# EasyEDA Pro project 恒温器.eprj, schematic Schematic2
Board Name: 加热器重制; Create Date: 2026-02-04; Page Name: P1; Project Name: 基准; Schematic Name: Schematic2; Update Date: 2026-02-23; Company: 嘉立创EDA; Page Size: A4; Version: V1.0
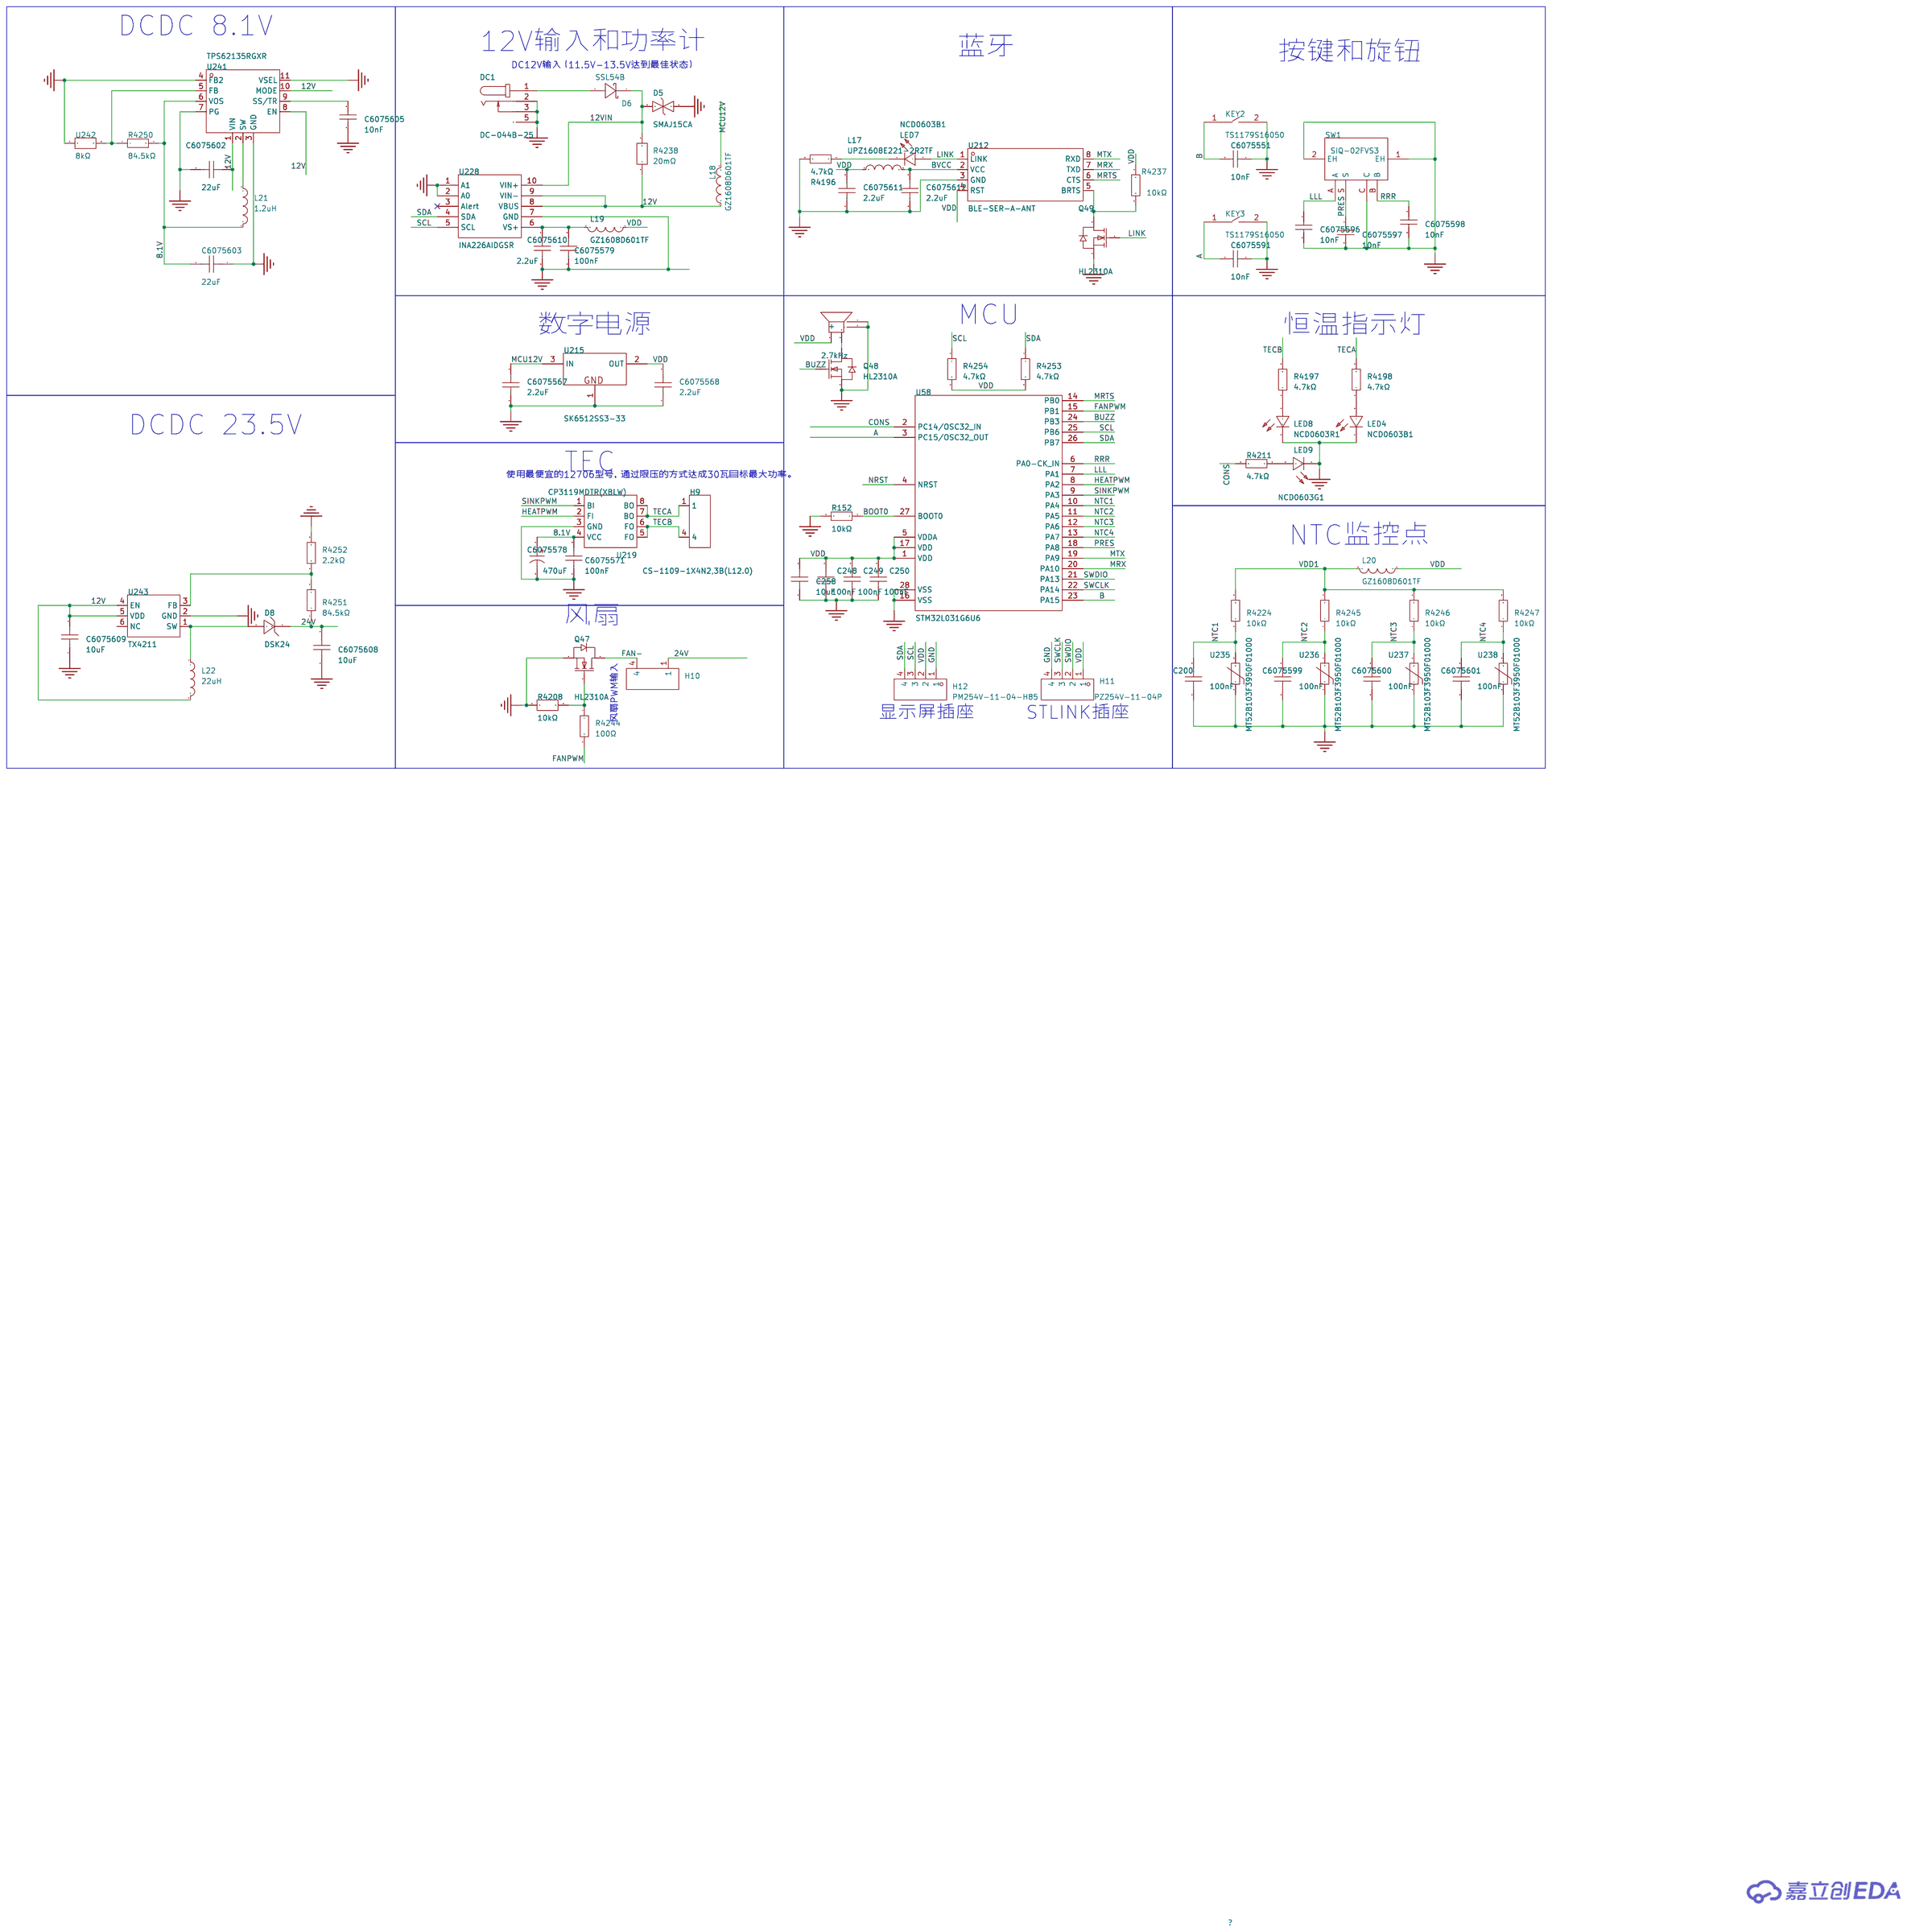
[diagram p0: schematic sheet]

## Parts
BUZZER1  2.7kHz  [BUZ-SMD_4P-L8.5-W8.5-P8.50-BR]
C200  100nF  [C0402]
C248  100nF  [C0603]
C249  100nF  [C0603]
C250  100nF  [C0603]
C258  10uF  [C0603]
C6075551  10nF  [C0603]
C6075567  2.2uF  [C0603]
C6075568  2.2uF  [C0603]
C6075571  100nF  [C0603]
C6075578  470uF  [CAP-TH_BD8.0-P3.50-D0.6-FD]
C6075579  100nF  [C0603]
C6075591  10nF  [C0603]
C6075596  10nF  [C0603]
C6075597  10nF  [C0603]
C6075598  10nF  [C0603]
C6075599  100nF  [C0402]
C6075600  100nF  [C0402]
C6075601  100nF  [C0402]
C6075602  22uF  [C0805]
C6075603  22uF  [C0805]
C6075605  10nF  [C0603]
C6075608  10uF  [C0805]
C6075609  10uF  [C0805]
C6075610  2.2uF  [C0603]
C6075611  2.2uF  [C0603]
C6075612  2.2uF  [C0603]
D5  SMAJ15CA  [SMA_L4.3-W2.6-LS5.0-BI]
D6  SSL54B  [SMBF_L4.3-W3.6-LS5.3-RD]
D8  DSK24  [SOD-123FL_L2.7-W1.8-LS3.8-RD]
DC1  DC-044B-25  [DC-IN-TH_DC-044B-25]
H9  CS-1109-1X4N2,3B(L12.0)  [HDR-TH_CS-1109-1X4N2-3B]
H10  CS-1109-1X4N2,3B(L12.0)  [HDR-TH_CS-1109-1X4N2-3B]
H11  PZ254V-11-04P  [HDR-TH_4P-P2.54-V-M]
H12  PM254V-11-04-H85  [HDR-TH_4P-P2.54-V-F]
KEY2  TS1179S16050  [KEY-SMD_L6.1-W6.0-LS6.7]
KEY3  TS1179S16050  [KEY-SMD_L6.1-W6.0-LS6.7]
L17  UPZ1608E221-2R2TF  [L0603]
L18  GZ1608D601TF  [L0603]
L19  GZ1608D601TF  [L0603]
L20  GZ1608D601TF  [L0603]
L21  1.2uH  [IND-SMD_L5.2-W5.4]
L22  22uH  [IND-SMD_L4.6-W4.2_SMMS0420]
LED4  NCD0603B1  [LED0603-RD]
LED7  NCD0603B1  [LED0603-RD]
LED8  NCD0603R1  [LED0603-RD_RED]
LED9  NCD0603G1  [LED0603-RD_1]
Q47  HL2310A  [SOT-23-3_L2.9-W1.3-P1.90-LS2.4-BR]
Q48  HL2310A  [SOT-23-3_L2.9-W1.3-P1.90-LS2.4-BR]
Q49  HL2310A  [SOT-23-3_L2.9-W1.3-P1.90-LS2.4-BR]
R152  10kΩ  [R0603]
R4196  4.7kΩ  [R0603]
R4197  4.7kΩ  [R0603]
R4198  4.7kΩ  [R0603]
R4208  10kΩ  [R0603]
R4211  4.7kΩ  [R0603]
R4224  10kΩ  [R0603]
R4237  10kΩ  [R0603]
R4238  20mΩ  [R2512]
R4244  100Ω  [R0603]
R4245  10kΩ  [R0603]
R4246  10kΩ  [R0603]
R4247  10kΩ  [R0603]
R4250  84.5kΩ  [R0603]
R4251  84.5kΩ  [R0603]
R4252  2.2kΩ  [R0603]
R4253  4.7kΩ  [R0603]
R4254  4.7kΩ  [R0603]
SW1  SIQ-02FVS3  [SW-SMD_SIQ-02FVS3]
U58  STM32L031G6U6  [UFQFPN-28_L4.0-W4.0-P0.50-BL]
U212  BLE-SER-A-ANT  [WIFI-SMD_8P-P1.27_CH9140]
U215  SK6512SS3-33  [SOT-23-3_L2.9-W1.6-P1.90-LS2.8-BR]
U219  CP3119MDTR(XBLW)  [SOP-8_L4.9-W3.9-P1.27-LS6.0-BL]
U228  INA226AIDGSR  [MSOP-10_L3.0-W3.0-P0.50-LS5.0-BL]
U235  MT52B103F3950F01000  [RES-TH_BD2.0-P1.80-D0.3]
U236  MT52B103F3950F01000  [RES-TH_BD2.0-P1.80-D0.3]
U237  MT52B103F3950F01000  [RES-TH_BD2.0-P1.80-D0.3]
U238  MT52B103F3950F01000  [RES-TH_BD2.0-P1.80-D0.3]
U241  TPS62135RGXR  [VQFN-HR-11_L3.0-W2.0-P0.50_TPS62135RGXR]
U242  8kΩ  [R0603]
U243  TX4211  [SOT-23-6_L2.9-W1.6-P0.95-LS2.8-BR]

## Library data of the parts
BUZZER1 = MLT-8530_C94599: 驱动方式:无源(外部驱动);构造类型:电磁式;额定电压:3.6V;频率:2.7kHz;声压(SPL):80dB;; LCSC Part Name: 无源(外部驱动) 电磁式 2.7kHz; Supplier Part: C94599; Manufacturer: 华能; Manufacturer Part: MLT-8530; Supplier Footprint: SMD,8.5x8.5mm; JLCPCB Part Class: 扩展库; Datasheet: https://item.szlcsc.com/datasheet/MLT-8530/95797.html; Supplier: LCSC; Driver Circuitry: 无源(外部驱动); Technology: 电磁式; Voltage Rating: 3.6V; Voltage - Supply: 2.5V~4.5V; Current Consumption: 95mA; Sound Pressure Level(SPL): 80dB; Length: 8.5mm; Width: 8.5mm; Height: 3.3mm; Operating Temperature: -20℃~+70℃; Mounting Type: 贴片
C200 C6075599-C6075601 = CL05B104KO5NNNC: LCSC Part Name: 100nF ±10% 16V; Supplier Part: C1525; Manufacturer: SAMSUNG(三星); Supplier Footprint: 0402; JLCPCB Part Class: 基础库; Datasheet: https://item.szlcsc.com/datasheet/CL05B104KO5NNNC/1877.html; Supplier: LCSC; Tolerance: ±10%; Voltage Rating: 16V; Temperature Coefficient: X7R
C248-C250 C6075579 = CC0603KRX7R9BB104: 容值:100nF;精度:±10%;额定电压:50V;材质(温度系数):X7R;; LCSC Part Name: 100nF ±10% 50V; Supplier Part: C14663; Manufacturer: YAGEO(国巨); Supplier Footprint: 0603; JLCPCB Part Class: 基础库; Datasheet: https://atta.szlcsc.com/upload/public/pdf/source/20180910/C282072_33301C7F631E79921B82A8DAC6BCC5B3.pdf; Supplier: LCSC; Tolerance: ±10%; Voltage Rated: 50V; Temperature Coefficient: X7R
C258 = CGA0603X5R106K100JT: LCSC Part Name: 10uF ±10% 10V; Supplier Part: C6119842; Manufacturer: HRE(芯声); Supplier Footprint: 0603; JLCPCB Part Class: 扩展库; Datasheet: https://item.szlcsc.com/datasheet/CGA0603X5R106K100JT/7062548.html; Supplier: LCSC; Tolerance: ±10%; Voltage Rating: 10V; Temperature Coefficient: X5R
C6075551 C6075591 C6075596-C6075598 C6075605 = CC0603KRX7R9BB103: LCSC Part Name: 10nF ±10% 50V; Supplier Part: C100042; Manufacturer: YAGEO(国巨); Supplier Footprint: 0603; JLCPCB Part Class: 扩展库; Datasheet: https://item.szlcsc.com/datasheet/CC0603KRX7R9BB103/101256.html; Supplier: LCSC; Tolerance: ±10%; Voltage Rating: 50V; Temperature Coefficient: X7R
C6075567 C6075568 C6075610-C6075612 = CL10A225KB8NNNC: LCSC Part Name: 2.2uF ±10% 50V; Supplier Part: C913904; Manufacturer: SAMSUNG(三星); Supplier Footprint: 0603; JLCPCB Part Class: 扩展库; Datasheet: https://item.szlcsc.com/datasheet/CL10A225KB8NNNC/984470.html; Supplier: LCSC; Tolerance: ±10%; Voltage Rating: 50V; Temperature Coefficient: X5R
C6075571 = CGA0603X7R104K500JT: LCSC Part Name: 100nF ±10% 50V; Supplier Part: C6119867; Manufacturer: HRE(芯声); Supplier Footprint: 0603; JLCPCB Part Class: 扩展库; Datasheet: https://item.szlcsc.com/datasheet/CGA0603X7R104K500JT/7062573.html; Supplier: LCSC; Tolerance: ±10%; Voltage Rating: 50V; Temperature Coefficient: X7R
C6075578 = RV471M250F070R1Z00ZZ: LCSC Part Name: 470uF ±20% 25V; Supplier Part: C51026670; Manufacturer: 创慧电子; Supplier Footprint: 插件,D8xL7mm; JLCPCB Part Class: 扩展库; Datasheet: https://item.szlcsc.com/datasheet/RV471M250F070R1Z00ZZ/53673856.html; Supplier: LCSC; Tolerance: ±20%; Voltage Rating: 25V; Diameter: 8mm; Height - Seated (Max): 7mm; Lifetime: 2000hrs@105℃; Operating Temperature: -55℃~+105℃
C6075602 C6075603 = FCC0805X226M250FT: LCSC Part Name: 22uF ±20% 25V; Supplier Part: C7419435; Manufacturer: FOJAN(富捷); Supplier Footprint: 0805; JLCPCB Part Class: Extended Part; Datasheet: https://item.szlcsc.com/datasheet/FCC0805X226M250FT/8393417.html; Supplier: LCSC; Tolerance: ±20%; Voltage Rating: 25V; Temperature Coefficient: X5R
C6075608 C6075609 = FCC0805X106K500FT: LCSC Part Name: 10uF ±10% 50V; Supplier Part: C46635915; Manufacturer: FOJAN(富捷); Supplier Footprint: 0805; Datasheet: https://item.szlcsc.com/datasheet/FCC0805X106K500FT/48791848.html; Supplier: LCSC; Tolerance: ±10%; Voltage Rating: 50V; Temperature Coefficient: X5R
D5 = SMAJ15CA_C19077536: LCSC Part Name: 双向TVS 15V截止 峰值浪涌电流：16.4A@10/1000us; Supplier Part: C19077536; Manufacturer: R+O(宏嘉诚); Supplier Footprint: DO-214AC(SMA); JLCPCB Part Class: 扩展库; Datasheet: https://item.szlcsc.com/datasheet/SMAJ15CA/20275621.html; Supplier: LCSC; Polarity: 双向; Reverse Stand-Off Voltage (Vrwm): 15V; Clamping Voltage: 24.4V; Peak Pulse Current (Ipp): 16.4A@10/1000us; Peak Pulse Power Dissipation (Ppp): 400W@10/1000us; Voltage - Breakdown: 18.5V; Reverse Leakage Current (Ir): 1uA; Number of Channels: 单路; Operating Temperature: -55℃~+150℃; level of protection: IEC 61000-4-2; Type: TVS
D6 = SSL54B_C28646278: LCSC Part Name: 电压:40V 电流:5A; Supplier Part: C28646278; Manufacturer: R+O(宏嘉诚); Supplier Footprint: SMB; JLCPCB Part Class: 扩展库; Datasheet: https://item.szlcsc.com/datasheet/SSL54B/30381024.html; Supplier: LCSC; Diode Configuration: 独立式; Voltage - Forward(Vf@If): 450mV@5A; Voltage - DC Reverse(Vr): 40V; Current - Rectified: 5A; Reverse Leakage Current (Ir): 1mA@40V; Operating Junction Temperature Range: -55℃~+150℃; Non-Repetitive Peak Forward Surge Current: 150A
D8 = DSK24_C22466352: LCSC Part Name: 电压:40V 电流:2A; Supplier Part: C22466352; Manufacturer: R+O(宏嘉诚); Supplier Footprint: SOD-123FL; JLCPCB Part Class: 扩展库; Datasheet: https://item.szlcsc.com/datasheet/DSK24/24165511.html; Supplier: LCSC; Diode Configuration: 独立式; Voltage - Forward(Vf@If): 550mV@2A; Voltage - DC Reverse(Vr): 40V; Current - Rectified: 2A; Reverse Leakage Current (Ir): 500uA@40V; Operating Junction Temperature Range: -55℃~+125℃; Non-Repetitive Peak Forward Surge Current: 50A
DC1 = DC-044B-25: LCSC Part Name: DC电源插座 内径:2.5mm 外径:6mm; Supplier Part: C22435683; Manufacturer: HanElectricity(瀚源); Supplier Footprint: 插件; JLCPCB Part Class: 扩展库; Datasheet: https://item.szlcsc.com/datasheet/DC-044B-25/24065957.html; Supplier: LCSC; Connector Type: DC电源插座; Mounting Type: 弯插; Inside Contact Diameter: 2.5mm; Outside Contact Diameter: 6mm
H9 H10 = CS-1109-1X4N2,3B(L12.0): LCSC Part Name: 1x4P(缺2P) 间距:2.54mm 方针 直插; Supplier Part: C5142871; Manufacturer: CST(永丰盈); Supplier Footprint: 插件,P=2.54mm; JLCPCB Part Class: 扩展库; Datasheet: https://item.szlcsc.com/datasheet/CS-1109-1X4N2%252C3B(L12.0)/5760133.html; Supplier: LCSC; Pin Structure: 1x4P(缺2P); Pitch: 2.54mm; Circluar Pins/Square Pins: 方针; Mounting Type: 直插; Number of Rows: 单排; Number of Pins: 2P(4P缺2P); Current Rating: 3A; Voltage Rating (Max): 250V; Length of Mating Pin: 4mm; Length of End Connection Pin: 3mm; Contact Material: 黄铜; Contact Plating: 金; Operating Temperature: -40℃~+105℃; Color: 黑色; Supplementary Features: 双塑
H11 = PZ254V-11-04P: LCSC Part Name: 1x4P 间距:2.54mm 方针 直插; Supplier Part: C2691448; Manufacturer: XFCN(兴飞); Supplier Footprint: 插件,P=2.54mm; JLCPCB Part Class: 扩展库; Datasheet: https://item.szlcsc.com/datasheet/PZ254V-11-04P/2801085.html; Supplier: LCSC; Pin Structure: 1x4P; Pitch: 2.54mm; Circluar Pins/Square Pins: 方针; Mounting Type: 直插; Number of Rows: 单排; Number of Pins: 4P; Current Rating: 3A; Voltage Rating (Max): 250V; Length of Mating Pin: 6mm; Insulation Height: 2.5mm; Length of End Connection Pin: 3mm; Operating Temperature: -40℃~+105℃; Color: 黑色
H12 = PM254V-11-04-H85: LCSC Part Name: 1x4P 间距:2.54mm 直插; Supplier Part: C541851; Manufacturer: XFCN(兴飞); Supplier Footprint: 插件,P=2.54mm; JLCPCB Part Class: 扩展库; Datasheet: https://item.szlcsc.com/datasheet/PM254V-11-04-H85/562472.html; Supplier: LCSC; Holes Structure: 1x4P; Pitch: 2.54mm; Circular Hole / Square Hole: 方孔; Mounting Type: 直插; Number of Rows: 单排; Number of Positions: 4P; Current Rating: 3A; Holes Direction: 顶部; Insulation Height: 8.5mm; Contact Material: 黄铜; Operating Temperature: -40℃~+105℃
KEY2 KEY3 = TS1179S16050: LCSC Part Name: 6.1mm*6mm 12V 50mA; Supplier Part: C22375344; Manufacturer: HanElectricity(瀚源); Supplier Footprint: SMD,6.1x6mm; JLCPCB Part Class: 扩展库; Datasheet: https://item.szlcsc.com/datasheet/TS1179S16050/23884769.html; Supplier: LCSC; Circuit: 单刀单掷; Actuator Style: 圆形按钮; Operating Force: 1.6N; Mounting Type: 立贴; Length: 6.1mm; Width: 6mm; with Bracket: 不带支架; Contact Current: 50mA; Voltage Rating: 12V; With Lamp: 无; Termination Style: J型引脚; Life: 10万次
L17 = UPZ1608E221-2R2TF: 阻抗 @ 频率:220Ω@100MHz;误差:±25%;直流电阻(DCR):50mΩ;; LCSC Part Name: 单路 0603磁珠 阻抗220Ω@100MHz; Supplier Part: C96997; Manufacturer: Sunlord(顺络); Supplier Footprint: 0603; JLCPCB Part Class: 扩展库; Datasheet: https://atta.szlcsc.com/upload/public/pdf/source/20241120/C9D5916648BC7FD0D56BAC9E90177F44.pdf; Supplier: LCSC; Impedance @ Frequency: 220Ω@100MHz; Tolerance: ±25%; DC Resistance: 50mΩ; Current Rating: 2.2A; Circuits: 1
L18-L20 = GZ1608D601TF: LCSC Part Name: 单路 0603磁珠 阻抗600Ω@100MHz; Supplier Part: C1002; Manufacturer: Sunlord(顺络); Supplier Footprint: 0603; JLCPCB Part Class: 基础库; Datasheet: https://item.szlcsc.com/datasheet/GZ1608D601TF/1354.html; Supplier: LCSC; Impedance @ Frequency: 600Ω@100MHz; Tolerance: ±25%; DC Resistance(DCR): 450mΩ; Current Rating: 200mA; Number of Circuits: 1; Operating Temperature: -55℃~+125℃
L21 = FXL0530-1R2-M: LCSC Part Name: 1.2uH ±20% 11A; Supplier Part: C524588; Manufacturer: cjiang(长江微电); Supplier Footprint: SMD,5.4x5.2mm; JLCPCB Part Class: 扩展库; Datasheet: https://item.szlcsc.com/datasheet/FXL0530-1R2-M/544084.html; Supplier: LCSC; Tolerance: ±20%; Current Rating: 8.5A; Current - Saturation(Isat): 11A; DC Resistance(DCR): 16mΩ; Type: 一体成型电感
L22 = SMMS0420-220M: LCSC Part Name: 22uH ±20% 1.5A; Supplier Part: C2894720; Manufacturer: SXN(顺翔诺); Supplier Footprint: SMD,4.6x4.2x2mm; JLCPCB Part Class: 扩展库; Datasheet: https://item.szlcsc.com/datasheet/SMMS0420-220M/3130467.html; Supplier: LCSC; Tolerance: ±20%; Current Rating: 1.2A; Current - Saturation(Isat): 1.5A; DC Resistance(DCR): 510mΩ
LED4 LED7 = NCD0603B1: LCSC Part Name: 片式发光二极管; Supplier Part: C84266; Manufacturer: 国星光电; Supplier Footprint: 0603; JLCPCB Part Class: 扩展库; Datasheet: https://item.szlcsc.com/datasheet/NCD0603B1/85435.html; Supplier: LCSC; Illumination Color: 蓝色; Voltage - Forward(Vf): 2.6V~3.6V; Power(Watts): 72mW; Forward Current: 10mA; Wavelength - Dominant: 463nm~475nm; Peak Wavelength: 465nm; Luminous Intensity: 220mcd; Viewing Angle: 130°; Operating Temperature: -30℃~+85℃
LED8 = NCD0603R1_C84263: LCSC Part Name: 片式发光二极管; Supplier Part: C84263; Manufacturer: 国星光电; Supplier Footprint: 0603; JLCPCB Part Class: 扩展库; Datasheet: https://item.szlcsc.com/datasheet/NCD0603R1/85432.html; Supplier: LCSC; Illumination Color: 红色; Voltage - Forward(Vf): 1.6V~2.6V; Power(Watts): 65mW; Forward Current: 25mA; Wavelength - Dominant: 615nm~630nm; Peak Wavelength: 630nm; Diode Configuration: 独立二极管; Luminous Intensity: 220mcd; Viewing Angle: 130°; Operating Temperature: -30℃~+85℃
LED9 = NCD0603G1: Supplier Part: C84267; Manufacturer: 国星光电; Supplier Footprint: 0603; JLCPCB Part Class: 扩展库; Datasheet: https://item.szlcsc.com/datasheet/NCD0603G1/85436.html; Supplier: LCSC; Illumination Color: 翠绿色; Voltage - Forward(Vf): 2.6V~3.6V; Power(Watts): 72mW; Forward Current: 20mA; Wavelength - Dominant: 515nm~530nm; Luminous Intensity: 330mcd~900mcd; Viewing Angle: 130°; Operating Temperature: -30℃~+85℃
Q47-Q49 = HL2310A: LCSC Part Name: 1个N沟道 耐压:60V 电流:3A; Supplier Part: C7420347; Manufacturer: R+O(宏嘉诚); Supplier Footprint: SOT-23; JLCPCB Part Class: 扩展库; Datasheet: https://item.szlcsc.com/datasheet/HL2310A/8397169.html; Supplier: LCSC; Number: 1个N沟道; Drain to Source Voltage: 60V; Current - Continuous Drain(Id): 3A; RDS(on): 90mΩ@10V；125mΩ@4.5V; Pd - Power Dissipation: 1.2W; Gate Threshold Voltage (Vgs(th)): 2V@250uA; Gate Charge(Qg): 6nC@4.5V; Input Capacitance(Ciss): 247pF; Reverse Transfer Capacitance (Crss@Vds): 19.5pF; Operating Temperature: -55℃~+150℃; Type: N沟道; Output Capacitance(Coss): 34pF
R152 R4237 = RT0603BRD0710KL: 电阻类型:薄膜电阻;阻值:10kΩ;精度:±0.1%;功率:100mW;最大工作电压:75V;温度系数:±25ppm/℃;; LCSC Part Name: 薄膜电阻 10kΩ ±0.1% 100mW; Supplier Part: C95204; Manufacturer: YAGEO(国巨); Supplier Footprint: 0603; JLCPCB Part Class: Extended Part; Datasheet: https://atta.szlcsc.com/upload/public/pdf/source/20170217/1487301593756.pdf; Supplier: LCSC; Type: 薄膜电阻; Tolerance: ±0.1%; Power(Watts): 100mW; Overload Voltage (Max): 75V; Temperature Coefficient: ±25ppm/℃; Operating Temperature Range: -55℃~+155℃
R4196-R4198 R4211 R4253 R4254 = 0603WAF4701T5E: 电阻类型:厚膜电阻;阻值:4.7kΩ;精度:±1%;功率:100mW;最大工作电压:75V;温度系数:±100ppm/℃;; LCSC Part Name: 4.7kΩ ±1% 100mW 厚膜电阻; Supplier Part: C23162; Manufacturer: UNI-ROYAL(厚声); Supplier Footprint: 0603; JLCPCB Part Class: Basic Part; Datasheet: https://atta.szlcsc.com/upload/public/pdf/source/20200306/C422600_1E6D84923E4A46A82E41ADD87F860B5C.pdf; Supplier: LCSC; Type: 厚膜电阻; Tolerance: ±1%; Power(Watts): 100mW; Overload Voltage (Max): 75V; Temperature Coefficient: ±100ppm/℃; Operating Temperature Range: -55℃~+155℃
R4208 = FRC0603J103 TS: LCSC Part Name: 10kΩ ±5% 100mW 厚膜电阻; Supplier Part: C2930027; Manufacturer: FOJAN(富捷); Supplier Footprint: 0603; JLCPCB Part Class: 扩展库; Datasheet: https://item.szlcsc.com/datasheet/FRC0603J103%2520TS/3266960.html; Supplier: LCSC; Type: 厚膜电阻; Tolerance: ±5%; Power(Watts): 100mW; Voltage-Supply(Max): 75V; Temperature Coefficient: ±100ppm/℃; Operating Temperature: -55℃~+155℃
R4224 R4245-R4247 = 0603WAF1002T5E: LCSC Part Name: 厚膜电阻 10kΩ ±1% 100mW; Supplier Part: C25804; Manufacturer: UNI-ROYAL(厚声); Supplier Footprint: 0603; JLCPCB Part Class: 基础库; Datasheet: https://item.szlcsc.com/datasheet/0603WAF1002T5E/26547.html; Supplier: LCSC; Type: 厚膜电阻; Tolerance: ±1%; Power(Watts): 100mW; Voltage-Supply(Max): 75V; Temperature Coefficient: ±100ppm/℃; Operating Temperature: -55℃~+155℃
R4238 = JER2512F3R050: LCSC Part Name: 50mΩ 3W 2512 ±1%; Supplier Part: C49164694; Manufacturer: JIERR(捷而瑞); Manufacturer Part: JER2512F3R020; Supplier Footprint: 2512; JLCPCB Part Class: 扩展库; Datasheet: https://item.szlcsc.com/datasheet/JER2512F3R050/48788254.html; Supplier: LCSC; Type: 采样电阻；合金电阻; Tolerance: ±1%; Power(Watts): 3W; Temperature Coefficient: ±50ppm/℃
R4244 = 0603WAF1000T5E: LCSC Part Name: 100Ω ±1% 100mW 厚膜电阻; Supplier Part: C22775; Manufacturer: UNI-ROYAL(厚声); Supplier Footprint: 0603; JLCPCB Part Class: 基础库; Datasheet: https://atta.szlcsc.com/upload/public/pdf/source/20200306/C422600_1E6D84923E4A46A82E41ADD87F860B5C.pdf; Supplier: LCSC; Type: 厚膜电阻; Tolerance: ±1%; Power(Watts): 100mW; Overload Voltage (Max): 75V; Temperature Coefficient: ±200ppm/℃; Operating Temperature Range: -55℃~+155℃
R4250 R4251 = 0603WAF8452T5E: LCSC Part Name: 84.5kΩ ±1% 100mW 厚膜电阻; Supplier Part: C23118; Manufacturer: UNI-ROYAL(厚声); Supplier Footprint: 0603; JLCPCB Part Class: 扩展库; Datasheet: https://item.szlcsc.com/datasheet/0603WAF8452T5E/23845.html; Supplier: LCSC; Type: 厚膜电阻; Tolerance: ±1%; Power(Watts): 100mW; Voltage-Supply(Max): 75V; Temperature Coefficient: ±100ppm/℃; Operating Temperature: -55℃~+155℃
R4252 = 0603WAF2201T5E: 电阻类型:厚膜电阻;阻值:2.2kΩ;精度:±1%;功率:100mW;最大工作电压:75V;温度系数:±100ppm/℃;; LCSC Part Name: 2.2kΩ ±1% 100mW 厚膜电阻; Supplier Part: C4190; Manufacturer: UNI-ROYAL(厚声); Supplier Footprint: 0603; JLCPCB Part Class: 基础库; Datasheet: https://atta.szlcsc.com/upload/public/pdf/source/20200306/C422600_1E6D84923E4A46A82E41ADD87F860B5C.pdf; Supplier: LCSC; Type: 厚膜电阻; Tolerance: ±1%; Power(Watts): 100mW; Overload Voltage (Max): 75V; Temperature Coefficient: ±100ppm/℃; Operating Temperature Range: -55℃~+155℃
SW1 = SIQ-02FVS3_C41430892: LCSC Part Name: 小电流编码器 SIQ-02FVS3 10型回转型; Supplier Part: C41430892; Manufacturer: HanElectricity(瀚源); Supplier Footprint: SMD; Datasheet: https://atta.szlcsc.com/upload/public/pdf/source/20241016/D55B4E0E552AACB89DAA63463155869E.pdf; Supplier: LCSC
U58 = STM32L031G6U6: CPU内核:ARM-M系列;应用领域:-;; LCSC Part Name: 超低功耗Arm Cortex-M0+ MCU，具有32-KB Flash存储器和32 MHz CPU; Supplier Part: C96514; Manufacturer: ST(意法半导体); Supplier Footprint: UFQFPN-28(4x4); JLCPCB Part Class: 扩展库; Datasheet: https://atta.szlcsc.com/upload/public/pdf/source/20170818/C115208_1503051154466895131.pdf; Supplier: LCSC; CPU Core: ARM-M系列; Program Storage Size: 32KB; Program Memory Type: FLASH
U212 = BLE-SER-A-ANT: LCSC Part Name: CH9140蓝牙转串口模块; Supplier Part: C2829462; Manufacturer: WCH(南京沁恒); Supplier Footprint: SMD,10.2x10.6mm; JLCPCB Part Class: 扩展库; Datasheet: https://atta.szlcsc.com/upload/public/pdf/source/20220415/E84741AD8F7214E5FBA61F031309F4A4.pdf; Supplier: LCSC
U215 = SK6512SS3-33: LCSC Part Name: 高压、低功耗低压差线性稳压器（LDO）; Supplier Part: C5120323; Manufacturer: suntek(洺太电子); Supplier Footprint: SOT-23-3; JLCPCB Part Class: 扩展库; Datasheet: https://item.szlcsc.com/datasheet/SK6512SS3-33/5704885.html; Supplier: LCSC; Output Type: 固定; Voltage - Supply: 36V; Output Voltage: 3.3V; Output Current: 200mA; Voltage Dropout: 820mV@(150mA); standby current: 1.5uA; Noise: 90uVrms; Features: 过流保护；短路保护; Operating Temperature: -40℃~+125℃@(Tj); Output Configuration: 正极; Number of Outputs: 1
U219 = CP3119MDTR(XBLW): LCSC Part Name: 30V/6A桥式驱动芯片; Supplier Part: C42395499; Manufacturer: XBLW(芯伯乐); Supplier Footprint: SOP-8; JLCPCB Part Class: 扩展库; Datasheet: https://item.szlcsc.com/datasheet/CP3119MDTR(XBLW)/44341333.html; Supplier: LCSC; Technology: 是; Number of H-bridges: 1; Output Current: 6A; Voltage - Supply: 3V~30V; RDS(on): 80mΩ; Quiescent Current(Iq): 1mA; Operating Temperature: -25℃~+85℃
U228 = INA226AIDGSR: LCSC Part Name: 高侧/低侧测量双向电流/功率监视器，具有I2C兼容接口; Supplier Part: C49851; Manufacturer: TI(德州仪器); Supplier Footprint: MSOP-10; JLCPCB Part Class: 扩展库; Datasheet: https://item.szlcsc.com/datasheet/INA226AIDGSR/50860.html; Supplier: LCSC; Vcm - Common Mode Voltage: 300mV~40V; Ib - Input Bias Current: 10nA; Vos - Input Offset Voltage: 2.5uV; Operating Temperature: -40℃~+125℃; Differential Voltage: -40V~+40V; Single Supply: 2.7V~5.5V; Quiescent Current: 330uA; Input Offset Voltage Drift(Vos TC): 0.1uV/℃; Common Mode Rejection Ratio (CMRR): 140dB
U235-U238 = MT52B103F3950F01000: LCSC Part Name: 负温度系数热敏电阻器; Supplier Part: C3000141; Manufacturer: STE(松田); Supplier Footprint: 插件; JLCPCB Part Class: 扩展库; Datasheet: https://item.szlcsc.com/datasheet/MT52B103F3950F01000/3480797.html; Supplier: LCSC; Resistance @ 25℃: 10kΩ; B Constant (25℃/50℃): 3950K; Resistance Tolerance: ±1%; B Constant (25℃/85℃): 4000K; B Constant Tolerance: ±1%; Operating Temperature: -40℃~+125℃; Dissipation Factor: 2mW/℃; Thermal Time Constant: 7s; Diameter (φD): 2mm
U241 = TPS62135RGXR: LCSC Part Name: 高精度3V至17V 4A降压转换器; Supplier Part: C167238; Manufacturer: TI(德州仪器); Supplier Footprint: VQFN-11-HR(2x3); JLCPCB Part Class: 扩展库; Datasheet: https://www.ti.com/cn/lit/gpn/tps62135; Supplier: LCSC; Function: 降压型; Output Type: 可调; Input Voltage: 3V~17V; Output Voltage: 800mV~12V; Output Current: 4A; Switching Frequency: 2.5MHz; Operating Temperature: -40℃~+125℃; Synchronous Rectification: 是; Number of Outputs: 1; Topology: 降压式; Quiescent Current (Iq): 18uA; Switch tube (built-in/external): 内置
U242 = RT0603BRE078KL: LCSC Part Name: 薄膜电阻 8kΩ ±0.1% 100mW; Supplier Part: C862311; Manufacturer: YAGEO(国巨); Supplier Footprint: 0603; JLCPCB Part Class: 扩展库; Datasheet: https://atta.szlcsc.com/upload/public/pdf/source/20200610/C326738_5639A9F1B6EB6E4AE2197577D3456E7F.pdf; Supplier: LCSC; Type: 薄膜电阻; Tolerance: ±0.1%; Power(Watts): 100mW; Temperature Coefficient: ±50ppm/℃; Operating Temperature Range: -55℃~+155℃
U243 = TX4211_C5440788: LCSC Part Name: 2A高效率的电流模式升压转换器; Supplier Part: C5440788; Manufacturer: XDS(芯鼎盛); Supplier Footprint: SOT-23-6L; JLCPCB Part Class: 扩展库; Datasheet: https://item.szlcsc.com/datasheet/TX4211/6325378.html; Supplier: LCSC; Function: 升压型; Voltage - Supply: 2V~24V; Output Current: 2A; Frequency - Switching: 1.2MHz; Operating Temperature: -40℃~+85℃@(TA); Number of Outputs: 1; Topology: 升压式; Quiescent Current: 100uA; Switch tube (built-in/external): 内置; Output Type: 可调

## Nets
8.1V: C6075571.2 C6075578.1 C6075603.2 L21.2 R4250.2 U219.4(VCC) U241.6(VOS)
12V: C6075602.1 C6075609.2 L18.1 L22.2 R4238.1 U228.8(VBUS) U228.9(VIN-) U241.1(VIN) U241.8(EN) U241.10(MODE) U243.4(EN) U243.5(VDD)
12VIN: D5.2 D6.1(C) R4238.2 U228.10(VIN+)
24V: C6075608.2 D8.1(C) H10.1 R4251.1
GND: BUZZER1.3 BUZZER1.4 C200.1 C248.1 C249.1 C250.1 C258.1 C6075551.1 C6075567.1 C6075568.1 C6075571.1 C6075578.2 C6075579.1 C6075591.1 C6075596.2 C6075597.2 C6075598.2 C6075599.1 C6075600.1 C6075601.1 C6075602.2 C6075603.1 C6075605.1 C6075608.1 C6075609.1 C6075610.1 C6075611.1 C6075612.1 D5.1 DC1.2 DC1.3 DC1.5 H11.4 H12.1 KEY2.2 KEY3.2 LED4.1(-) LED8.1(K) LED9.1(K) Q47.2(S) Q48.2(S) Q49.2(S) R152.2 R4196.2 R4208.1 R4252.2 SW1.1(EH) SW1.2(EH) SW1.C U58.16(VSS) U58.28(VSS) U212.3(GND) U215.1(GND) U219.3(GND) U228.1(A1) U228.2(A0) U228.7(GND) U235.1 U236.1 U237.1 U238.1 U241.3(GND) U241.4(FB2) U241.7(PG) U241.11(VSEL) U242.1 U243.2(GND)
VDD: BUZZER1.1(+) C248.2 C249.2 C250.2 C258.2 C6075568.2 C6075611.2 H11.1 H12.2 L17.1 L19.1 L20.1 R4237.1 R4253.2 R4254.2 U58.1(VDD) U58.5(VDDA) U58.17(VDD) U212.4(RST) U215.2(OUT)
VDD1: L20.2 R4224.2 R4245.2 R4246.2 R4247.2
A: C6075591.2 KEY3.1 U58.3(PC15/OSC32_OUT)
B: C6075551.2 KEY2.1 U58.23(PA15)
BOOT0: R152.1 U58.27(BOOT0)
BUZZ: Q48.1(G) U58.24(PB3)
BVCC: C6075612.2 L17.2 U212.2(VCC)
CONS: R4211.2 U58.2(PC14/OSC32_IN)
FAN-: H10.4 Q47.3(D)
FANPWM: R4244.2 U58.15(PB1)
HEATPWM: U58.8(PA2) U219.2(FI)
LINK: LED7.2(+) Q49.1(G) U212.1(LINK)
LLL: C6075596.1 SW1.A U58.7(PA1)
MCU12V: C6075567.2 L18.2 U215.3(IN)
MRTS: U58.14(PB0) U212.6(CTS)
MRX: U58.20(PA10) U212.7(TXD)
MTX: U58.19(PA9) U212.8(RXD)
NRST: U58.4(NRST)
NTC1: C200.2 R4224.1 U58.10(PA4) U235.2
NTC2: C6075599.2 R4245.1 U58.11(PA5) U236.2
NTC3: C6075600.2 R4246.1 U58.12(PA6) U237.2
NTC4: C6075601.2 R4247.1 U58.13(PA7) U238.2
PRES: C6075597.1 SW1.S U58.18(PA8)
RRR: C6075598.1 SW1.B U58.6(PA0-CK_IN)
SCL: H12.3 R4254.1 U58.25(PB6) U228.5(SCL)
SDA: H12.4 R4253.1 U58.26(PB7) U228.4(SDA)
SINKPWM: U58.9(PA3) U219.1(BI)
SWCLK: H11.3 U58.22(PA14)
SWDIO: H11.2 U58.21(PA13)
TECA: H9.1 R4198.2 U219.7(BO) U219.8(BO)
TECB: H9.4 R4197.2 U219.5(FO) U219.6(FO)
$1N6444: LED4.2(+) R4198.1
$1N6548: Q49.3(D) R4237.2 U212.5(BRTS)
$1N6553: Q47.1(G) R4208.2 R4244.1
$1N6565: C6075579.2 C6075610.2 L19.2 U228.6(VS+)
$1N6582: LED7.1(-) R4196.1
$1N11196: D6.2(A) DC1.1
$1N19267: LED8.2(A) R4197.1
$1N28156: LED9.2(A) R4211.1
$1N35736: R4250.1 U241.5(FB) U242.2
$1N35752: L21.1 U241.2(SW)
$1N35764: C6075605.2 U241.9(SS/TR)
$1N38178: D8.2(A) L22.1 U243.1(SW)
$1N38198: R4251.2 R4252.1 U243.3(FB)
$1N40943: BUZZER1.2 Q48.3(D)

Not connected (* = marked no-connect by the designer): U228 3(Alert)*; U243 6(NC)

## Notes on the sheet
- DCDC 8.1V
- 12V输入和功率计
- 蓝牙
- DC12V输入（11.5V-13.5V达到最佳状态）
- 按键和旋钮
- MCU
- 数字电源
- 恒温指示灯
- DCDC 23.5V
- 使用最便宜的12706型号，通过限压的方式达成30瓦目标最大功率。
- TEC
- NTC监控点
- 风扇
- 风扇PWM输入
- 显示屏插座
- STLINK插座
